# Altium schematic sheet ISO_DC_12_DC_5.SchDoc: =DocumentName
size A4; ModifiedBy: -; CheckedDate: -; DivGrp: WUT ISE; Designer: G.Kasprowicz; DocumentNumber: 1; Revision: 0; SheetNumber: 4; SheetTotal: 6
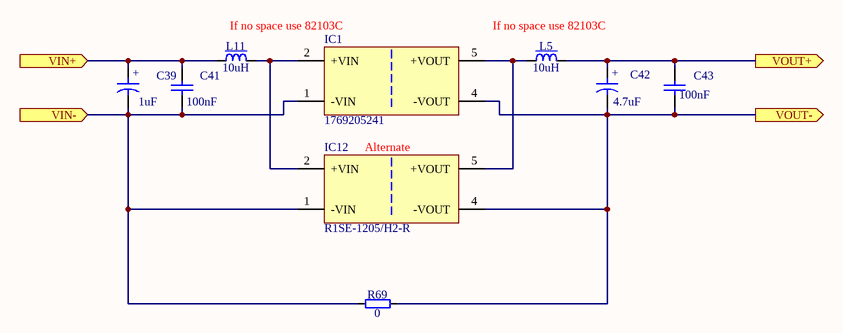
[diagram p0: ISO_DC_12_DC_5.SchDoc]

## Parts
C39  1uF  [CAPMP6032X280N]
C41  100nF  [CAPC1005X55N]
C42  4.7uF  [CAPMP3216X180N]
C43  100nF  [CAPC1005X55N]
IC1  1769205241  [WPME-FISM_SMT-8_L13.2W11.4H7.25]
IC12  R1SE-1205/H2-R  [R1SE-1205_H2-R]
L5  10uH  [IND_MURATA-PS_8400]
L11  10uH  [IND_MURATA-PS_8400]
R69  0  [RESC3216X65N]

## Ports
VIN+ (in), VIN- (in), VOUT+ (out), VOUT- (out)

## Nets
VIN+: C39.1 C41.2 L11.2 ; port VIN+
VIN-: C39.2 C41.1 IC1.1(-VIN) IC12.1(-VIN) R69.1 ; port VIN-
VOUT+: C42.1 C43.2 L5.1 ; port VOUT+
VOUT-: C42.2 C43.1 IC1.4(-VOUT) IC12.4(-VOUT) R69.2 ; port VOUT-
NetIC1_2: IC1.2(+VIN) IC12.2(+VIN) L11.1
NetIC1_5: IC1.5(+VOUT) IC12.5(+VOUT) L5.2

## Notes on the sheet
- If no space use 82103C
- (near IC12) Alternate
- Release
- Last modified =ModifiedDate
  Sheet =sheetnumber of =sheettotal · Size A4
- Copyright =P_copyright_owner
  This source describes Open Hardware and is licensed under the CERN-OHL-W v2. You may redistribute and modify this source and make products using it under the terms of the CERN-OHL-W v2 (https://cern.ch/cern-ohl). This source is distributed WITHOUT ANY EXPRESS OR IMPLIED WARRANTY, INCLUDING OF MERCHANTABILITY, SATISFACTORY QUALITY AND FITNESS FOR A PARTICULAR PURPOSE. Please see the CERN-OHL-W v2 for applicable conditions.
  Notice: If You produce hardware based on this source, You must maintain the Source Location visible on the product, its packaging or its documentation.
- SINARA OPEN HARDWARE
- OPEN HARDWARE FOR SCIENTIFIC INSTRUMENTATION
- https://github.com/sinara-hw
- Release owner
- Designers
- Reviewers
- Source location:
- (in symbol CTE3216-18_4.7UF_16V_10%_LESR2000) +
- (in symbol CTE6032-28_1UF_50V_10%) +

## Library data of the parts
C39 = CTE6032-28_1UF_50V_10%: Polarised capacitor; Part Description: Solid Tantalum Chip Capacitor; Manufacturer: GENERIC; Manufacturer1 Part Number: TAJC105K050R; Voltage: 50V; Tolerance: ±10%; Part Number: CTE6032-28_1UF_50V_10%; Component Kind: Standard; Component Type: Standard; Pin Count: 2; Value: 1uF; Status: Preferred; Manufacturer Part Number: CTE6032-28_1UF_50V_10%; Case: C; Mounted: Yes; Socket: No; SMD: Yes; Sense: No; Manufacturer1 Example: AVX; Manufacturer1 ComponentHeight: 2.8mm; HelpURL: \\cern.ch\dfs\Applications\Altium\Datasheets\CTE_AVX_TAJ.pdf; Author: CERN DEM JLC; CreateDate: 03.12.2007; LatestRevisionDate: 03.12.2007
C41 C43 = CC0402_100NF_50V_10%_X7R: Non-polarised capacitor; Part Description: SMD Multilayer Chip Ceramic Capacitor; Manufacturer: GENERIC; Manufacturer1 Part Number: GRM155R71H104KE14D; Voltage: 50V; TC: X7R; Tolerance: ±10%; Part Number: CC0402_100NF_50V_10%_X7R; Component Kind: Standard; Component Type: Standard; Pin Count: 2; Value: 100nF; Status: None; Manufacturer Part Number: CC0402_100NF_50V_10%_X7R; Case: 0402; Mounted: Yes; Socket: No; SMD: Yes; Sense: No; HelpURL: \\cern.ch\dfs\Applications\Altium\Datasheets\CC0402_MURATA_GRM155R71H104KE14D.pdf; Author: CERN DEM MR; CreateDate: 30.06.2017; LatestRevisionDate: 30.06.2017; Manufacturer1 Example: MURATA; Manufacturer1 ComponentHeight: 0.55mm
C42 = CTE3216-18_4.7UF_16V_10%_LESR2000: Polarised capacitor; Part Description: Low ESR 2R0 Solid Tantalum Chip Capacitor; Manufacturer: GENERIC; Manufacturer1 Part Number: TPSA475K016R2000; Voltage: 16V; Tolerance: ±10%; Part Number: CTE3216-18_4.7UF_16V_10%_LESR2000; Component Kind: Standard; Component Type: Standard; Pin Count: 2; Value: 4.7uF; Status: Preferred; Manufacturer Part Number: CTE3216-18_4.7UF_16V_10%_LESR2000; Case: A; Mounted: Yes; Socket: No; SMD: Yes; Sense: No; Manufacturer1 Example: AVX; Manufacturer1 ComponentHeight: 1.8mm; HelpURL: \\cern.ch\dfs\Applications\Altium\Datasheets\CTE-LESR_AVX_TPS.pdf; Author: CERN DEM JLC; CreateDate: 03.09.2012; LatestRevisionDate: 03.09.2012
IC1 = CMP-019-00162-2: Dc-Dc Converter, 5V, 0.2A Rohs Compliant: Yes; Manufacturer: Wurth Elektronik; Isolation Voltage: 3kV; Output Current: 200mA; Max Supply Voltage: 13.2V; Height: 7.25mm; Manufacturer Part Search: 1769205241; Width: 11.4mm; Length: 13.2mm
IC12 = CMP-019-00163-2: 1W DC/DC-Converter 'ECONOLINE' SMD 2kV unreg; V. In: 12; V. Out: 05; mA. Out: 200; Manufacturer: RECOM Power; Output Voltage: 5V; Max Supply Voltage: 13.2V; Max Operating Temperature: 100°C; Min Operating Temperature: -40°C; Mounting Technology: Surface Mount; Case/Package: SMD/SMT; Manufacturer Part Number: R1SE-1205/H2-R; Height: 6.7mm; Max Power Dissipation: 1W
L5 L11 = IND_10UH_10%_MURATA-PS_8400: Inductor With Core; Part Description: Miniature Surface Mount Power Inductor (8400 Serie); Manufacturer: MURATA POWER SOLUTIONS; Manufacturer Part Number: 84103C; Power: 950mA; Resistance: 0.24R; Tolerance: ±10%; Part Number: IND_10UH_10%_MURATA-PS_8400; Component Kind: Standard; Component Type: Standard; Pin Count: 2; Value: 10uH; Status: None; Mounted: Yes; Socket: No; SMD: Yes; Sense: No; ComponentHeight: 2.9mm; HelpURL: \\cern.ch\dfs\Applications\Altium\Datasheets\IND_MURATA-PS_8400.pdf; Author: CERN DEM JLC; CreateDate: 02.07.2012; LatestRevisionDate: 02.07.2012
R69 = R1206_0R_JUMPER: Resistor; Part Description: 2A (0.05R Max DC Resistance) Zero Ohm Jumper; Manufacturer: GENERIC; Manufacturer1 Part Number: NRC12Z0; PressFit: No; Part Number: R1206_0R_JUMPER; Component Kind: Standard; Component Type: Standard; Pin Count: 2; Value: 0; Status: Preferred; Manufacturer Part Number: R1206_0R_JUMPER; Case: 1206; Mounted: Yes; Sense: No; Socket: No; SMD: Yes; Manufacturer1 Example: NIC COMPONENT; Manufacturer1 ComponentHeight: 0.65mm; HelpURL: \\cern.ch\dfs\Applications\Altium\Datasheets\R1206_NIC_NRC.pdf; Author: CERN DEM JLC; CreateDate: 03.12.2007; LatestRevisionDate: 13.03.2008